# Altium schematic sheet 12_WIFI.SchDoc
size A; SheetNumber: 12; SheetTotal: 12
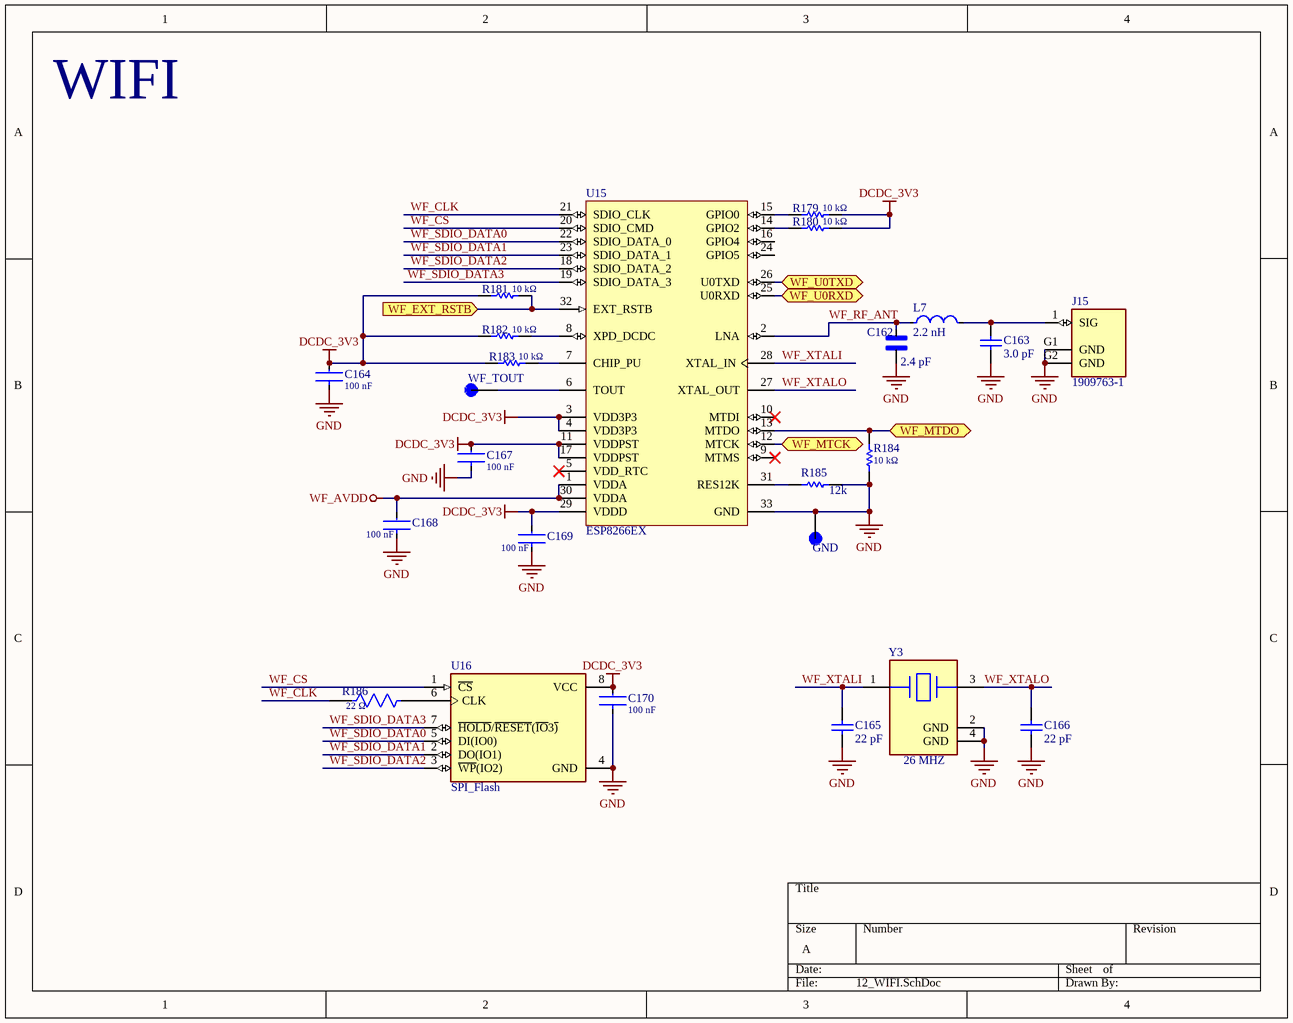
[diagram p0: 12_WIFI.SchDoc]

## Parts
C162  2.4 pF  [CAPC1005X55N]
C163  3.0 pF  [CAPC1005X55X25ML05T10]
C164  100 nF  [FP-CC0603-DA-MFG]
C165  22 pF  [CAPC1608X90X40NL10T20]
C166  22 pF  [CAPC1608X90X40NL10T20]
C167  100 nF  [FP-CC0603-DA-MFG]
C168  100 nF  [FP-CC0603-DA-MFG]
C169  100 nF  [FP-CC0603-DA-MFG]
C170  100 nF  [FP-CC0603-DA-MFG]
GND  (no value)  [KEYSTONE_5277]
J15  1909763-1  [TE_1909763-1]
L7  2.2 nH  [FP-LQW15AN_80-MFG]
R179  10 kΩ  [RESC1608X55X25ML10T15]
R180  10 kΩ  [RESC1608X55X25ML10T15]
R181  10 kΩ  [RESC1608X55X25ML10T15]
R182  10 kΩ  [RESC1608X55X25ML10T15]
R183  10 kΩ  [RESC1608X55X25ML10T15]
R184  10 kΩ  [RESC1608X55X25ML10T15]
R185  12k  [RESC1608X55X25NL10T15]
R186  22 Ω  [FP-RC0603-0_55-IPC_C]
U15  ESP8266EX  [ESFS-QFN-32_L]
U16  SPI_Flash  [SOIC127P790X216-8N]
WF_TOUT  (no value)  [KEYSTONE_5277]
Y3  26 MHZ  [FP-ABM8G-MFG]

## Ports
WF_EXT_RSTB (in), WF_MTCK (bidir), WF_MTDO (bidir), WF_U0RXD (bidir), WF_U0TXD (bidir)

## Nets
DCDC_3V3: C164.2 C167.2 C169.2 C170.2 R179.1 R180.1 R181.2 R182.2 R183.2 U15.3(VDD3P3) U15.4(VDD3P3) U15.11(VDDPST) U15.17(VDDPST) U15.29(VDDD) U16.8(VCC)
GND: C162.1 C163.1 C164.1 C165.1 C166.1 C167.1 C168.1 C169.1 C170.1 GND.1(TP) J15.G1(GND) J15.G2(GND) R184.2 R185.2 U15.33(GND) U16.4(GND) Y3.2(GND) Y3.4(GND)
WF_AVDD: C168.2 U15.1(VDDA) U15.30(VDDA)
WF_CLK: R186.1 U15.21(SDIO_CLK)
WF_CS: U15.20(SDIO_CMD) U16.1(~{CS})
WF_EXT_RSTB: R181.1 U15.32(EXT_RSTB) ; port WF_EXT_RSTB
WF_MTCK: U15.12(MTCK) ; port WF_MTCK
WF_MTDO: R184.1 U15.13(MTDO) ; port WF_MTDO
WF_RF_ANT: C162.2 L7.1 U15.2(LNA)
WF_SDIO_DATA0: U15.22(SDIO_DATA_0) U16.5(DI(IO0))
WF_SDIO_DATA1: U15.23(SDIO_DATA_1) U16.2(DO(IO1))
WF_SDIO_DATA2: U15.18(SDIO_DATA_2) U16.3(~{WP}(IO2))
WF_SDIO_DATA3: U15.19(SDIO_DATA_3) U16.7(~{HOLD}/~{RESET}(~{IO}3~{)})
WF_U0RXD: U15.25(U0RXD) ; port WF_U0RXD
WF_U0TXD: U15.26(U0TXD) ; port WF_U0TXD
WF_XTALI: C165.2 U15.28(XTAL_IN) Y3.1
WF_XTALO: C166.2 U15.27(XTAL_OUT) Y3.3
NetC163_2: C163.2 J15.1(SIG) L7.2
NetR179_2: R179.2 U15.15(GPIO0)
NetR180_2: R180.2 U15.14(GPIO2)
NetR182_1: R182.1 U15.8(XPD_DCDC)
NetR183_1: R183.1 U15.7(CHIP_PU)
NetR185_1: R185.1 U15.31(RES12K)
NetR186_2: R186.2 U16.6(CLK)
NetU15_6: U15.6(TOUT) WF_TOUT.1(TP)

Not connected (* = marked no-connect by the designer): U15 5(VDD_RTC)* 9(MTMS)* 10(MTDI)* 16(GPIO4) 24(GPIO5)

## Notes on the sheet
- WIFI

## Library data of the parts
C162 = GRM1555C1H2R4WA01D: SMD Capacitor C0G(EIA) with Capacitance: 2.4pF Tol. 0.05pF. Rated Voltage: 50Vdc; MF: Murata; SnapEDA_Link: https://www.snapeda.com/parts/GRM1555C1H2R4WA01D/Murata/view-part/?ref=snap; Package: 1005-2 Murata; Value: *; MP: GRM1555C1H2R4WA01D; Check_prices: https://www.snapeda.com/parts/GRM1555C1H2R4WA01D/Murata/view-part/?ref=eda
C163 = CMP-1034-00237-2: Manufacturer: Murata; Part Number: GRM1555C1H3R0WA01D
C164 C167-C170 = CMP-2100-03601-2: CAP CER 0.1UF 50V X7R 0603; Manufacturer: YAGEO; Manufacturer Part Number: CC0603KRX7R9BB104; Material: Ceramic; Temperature Coefficient: 15%; Tolerance: 0.1; Height: 0.9mm; Voltage: 50 V; ComponentLink2Description: Datasheet; Device Class L2: Capacitors; Temperature Range High: +125°C; Category: Cap; Capacitance: 100 nF; Footprint Url: http://www.yageo.com/exep/pages/download/literatures/UPY-C_GEN_24.pdf; ComponentLink2URL: http://www.yageo.com/documents/recent/UPY-GPHC_X7R_6.3V-to-50V_18.pdf; Package: CC0603-DA; Temperature: -55°C to +125°C; Voltage Rating: 50 V; Temperature Characteristic: X7R; Device Class L1: Passive Components; Temperature Range Low: -55°C; RoHS: TRUE; Automotive: No; Value: 100 nF; Device Class L3: Ceramic Capacitors; Octopart: https://octopart.com/cc0603krx7r9bb104-yageo-42244635; Mouser Description: Multilayer Ceramic Capacitor, CC Series, 0.1 - F, - 10%, X7R, 50 V, 0603 [1608 Metric]; Lead Free: Yes; Digikey Description: CAP CER 0.1UF 50V X7R 0603
C165 C166 = CMP-1659-00026-1: Chip Capacitor, 22 pF, +/- 5%, 50 V, -55 to 125 degC, 0603 (1608 Metric), RoHS, Tape and Reel; ComponentLink1URL: http://www.yageo.com/; PackageReference: 0603; ComponentLink1Description: Manufacturer URL; PackageDescription: 2-Pin Surface Mount Device, Body 1.6 x 0.8 mm; DatasheetVersion: Rev. 8, 08/2011; ComponentLink2Description: Datasheet; ComponentLink2URL: http://www.yageo.com/documents/recent/UPY-GP_NP0_16V-to-50V_8.pdf
GND WF_TOUT = 5277: TEST POINT (BLUE) - COMPACT; MF: Keystone Electronics; SnapEDA_Link: https://www.snapeda.com/parts/5277/Keystone/view-part/?ref=snap; Package: None; Value: *; MP: 5277; Check_prices: https://www.snapeda.com/parts/5277/Keystone/view-part/?ref=eda
L7 = CMP-06042-014713-1: Wire Wound RF Inductor 2.2nH ±2% 2530mA 0.022Ω 0402 (1005)
R179-R184 = CMP-2000-05022-1: Resistor, 10 KOhm, +/- 5%, 100 mW, -55 to 155 degC, 0603 (1608 Metric), RoHS, Tape and Reel; Manufacturer: Yageo; Resistance: 10kOhms; Voltage Rating: 50V; Temperature Coefficient: 100PPM/C; Power Rating: 100mW; Package Reference: 603; Series: RC; Case Code - mm: 1608; Packaging: Reel; Datasheet URL: http://www.farnell.com/datasheets/443971.pdf; Datasheet Version: Rev. 4, 04/2009; Operating Temperature Range: -55Cto+155C; Product: ThickFilmResistorsGeneralPurpose; Package Description: 2-Pin Surface Mount Device, Body 1.6 x 0.8 mm; Manufacturer URL: http://www.yageo.com/; Case Code - in: 0603; Tolerance: 5%; Termination Style: SMD/SMT
R185 = CMP-1659-00047-2: Chip Resistor, 12 KOhm, +/- 1%, 100 mW, -55 to 155 degC, 0603 (1608 Metric), RoHS, Tape and Reel; Resistance: 12 kohm; Power Rating: 100 mW; Voltage Rating (DC): 50 V; Case\Package: 0603; ComponentLink2URL: http://www.yageo.com/documents/recent/PYu-RC_Group_51_RoHS_L_04.pdf; Case Code (Imperial): 0603; ComponentLink2Description: Datasheet; Height: 0.45 mm; Case Code (Metric): 1608; RoHSCompliant: true; Max Operating Temperature: 155 degC; Width: 0.8 mm; Mount: Surface Mount; ComponentLink1URL: http://www.yageo.com/; Pins: 2; Tolerance: 1%; Min Operating Temperature: -55 degC; Length: 1.6 mm; PackageReference: 0603; REACH SVHC: No SVHC; PackageDescription: 2-Pin Surface Mount Device, Body 1.6 x 0.8 mm; Voltage Rating: 50 V; Packaging: Tape and Reel; Package Quantity: 5000; ComponentLink1Description: Manufacturer URL; DatasheetVersion: Rev. 4, 02/2016
R186 = CMP-03412-037819-1: RES SMD 22 OHM 5% 1/10W 0603; Temperature Coefficient: 100ppm/°C; Max Power Dissipation: 100mW; Voltage Rating: 50V; Resistance: 22R; Length: 1.6mm; Tolerance: 5%; Resistance Tolerance: 5%; Number of Terminations: 2; Construction: Rectangular; Min Operating Temperature: -55°C; Lead Free: Lead Free; Width: 0.8mm; Case Code (Imperial): 0603; Voltage Rating (DC): 50V; Case/Package: 0603; Features: Moisture Resistant; REACH SVHC: No SVHC; Military Standard: Not; RoHS Compliant: Yes; Max Operating Temperature: 155°C; Number of Pins: 2; Termination: SMD/SMT; Case Code (Metric): 1608; Packaging: Tape and Reel; Resistor Type: Thick Film; Depth: 0.8mm; Size Code: 0603; Power Rating: 100mW; Series: RC
U15 = CMP-2000-07453-1: Low-Power, Highly-Integrated Wi-Fi Solution, 2.5 to 3.6 V, 80 mA, -40 to 125 degC, 32-Pin QFN; Manufacturer: Espressif Systems; Mounting Technology: SurfaceMount; Datasheet URL: http://espressif.com/sites/default/files/documentation/0a-esp8266ex_datasheet_en.pdf; Package Reference: QFN-32; Package Description: 32-Pin Quad Falt No-Lead, Body 5 x 5 mm, Pitch 0.5 mm; Manufacturer URL: http://espressif.com; Datasheet Version: Rev. 5.4, 04/2017
U16 = W25Q32JVSSIQ: FLASH - NOR Memory IC 32Mb (4M x 8) SPI - Quad I/O 133 MHz 8-SOIC; MF: Winbond; SnapEDA_Link: https://www.snapeda.com/parts/W25Q32JVSSIQ/Winbond+Electronics/view-part/?ref=snap; Package: SOIC-8 Winbond; Value: *; MP: W25Q32JVSSIQ; Check_prices: https://www.snapeda.com/parts/W25Q32JVSSIQ/Winbond+Electronics/view-part/?ref=eda
Y3 = CMP-27762-015775-1: Crystal 26MHz ±20ppm (Tol) ±30ppm (Stability) 18pF FUND 60Ω 4-Pin SMD T/R; ESR (Equivalent Series Resistance): 60R; Frequency Stability: 30ppm; Max Operating Temperature: 85°C; Case/Package: CSMD; Tolerance: 20ppm; Package Quantity: 1000; Packaging: Tape and Reel; Lead Free: Lead Free; Frequency: 26MHz; Width: 2.5mm; Mount: Surface Mount; Frequency Tolerance: 20ppm; Operating Frequency: 26 MHz; Depth: 2.5mm; Height: 1mm; Min Operating Temperature: -40°C; Load Capacitance: 18pF; Termination: SMD/SMT; Length: 3.2mm; Series: ABM8G
J15 = 1909763-1: Package: None; Price: None; Value: *; MP: 1909763-1; Availability: Unavailable